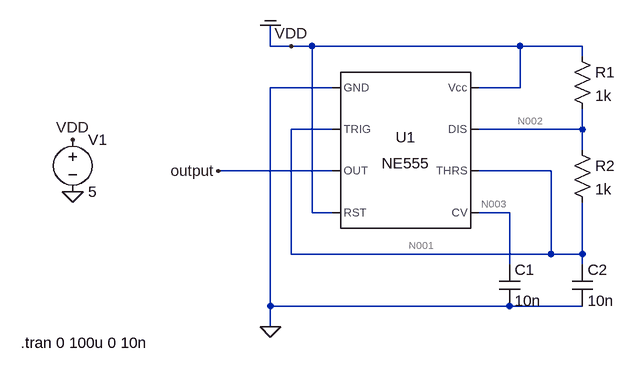
[diagram p0: schematic Design2_1k.asc]
Design2_1k.asc, the LTspice schematic file:
Version 4
SHEET 1 880 680
WIRE 16 16 16 -16
WIRE 48 16 16 16
WIRE 80 16 48 16
WIRE 400 16 80 16
WIRE 496 16 400 16
WIRE 496 32 496 16
WIRE 112 80 16 80
WIRE 400 80 400 16
WIRE 400 80 336 80
WIRE 112 144 48 144
WIRE 496 144 496 112
WIRE 496 144 336 144
WIRE 496 176 496 144
WIRE 112 208 -64 208
WIRE 448 208 336 208
WIRE 80 272 80 16
WIRE 112 272 80 272
WIRE 384 272 336 272
WIRE 48 336 48 144
WIRE 448 336 448 208
WIRE 448 336 48 336
WIRE 496 336 496 256
WIRE 496 336 448 336
WIRE 384 352 384 272
WIRE 496 352 496 336
WIRE 16 416 16 80
WIRE 384 416 16 416
WIRE 496 416 384 416
WIRE 16 448 16 416
FLAG 16 448 0
FLAG 16 -16 COM
FLAG 48 16 VDD
FLAG -64 208 output
FLAG -288 160 VDD
FLAG -288 240 0
SYMBOL Misc\\NE555 224 176 R0
SYMATTR InstName U1
SYMBOL cap 368 352 R0
SYMATTR InstName C1
SYMATTR Value 10n
SYMBOL cap 480 352 R0
SYMATTR InstName C2
SYMATTR Value 10n
SYMBOL res 480 16 R0
SYMATTR InstName R1
SYMATTR Value 1k
SYMBOL res 480 160 R0
SYMATTR InstName R2
SYMATTR Value 1k
SYMBOL voltage -288 144 R0
WINDOW 123 0 0 Left 0
WINDOW 39 0 0 Left 0
SYMATTR InstName V1
SYMATTR Value 5
TEXT -368 472 Left 2 !.tran 0 100u 0 10n

The netlist it stands for:
* Design2_1k.asc
XU1 0 N001 output VDD N003 N001 N002 VDD NE555  ; pins GND TRIG OUT RST CV THRS DIS Vcc
C1 N003 0 10n
C2 N001 0 10n
R1 VDD N002 1k
R2 N002 N001 1k
V1 VDD 0 5
.tran 0 100u 0 10n
.lib NE555.sub
.backanno
.end

* Results of the author's LTspice run, read from the files saved beside the schematic
* Operating Point, zero values left out:
*   V(n001) = 5 V
*   V(n003) = 3.333 V
*   V(vdd) = 5 V
*   V(n002) = 5 V
*   V(output) = 5 V
*   I(R2) = 10 nA
*   I(R1) = 16.67 nA
*   I(V1) = -1.611 mA
*   Ix(u1:1) = -1.611 mA
*   Ix(u1:2) = 5 nA
*   Ix(u1:4) = 22.67 µA
*   Ix(u1:6) = 5 nA
*   Ix(u1:7) = 6.672 nA
*   Ix(u1:8) = 1.588 mA
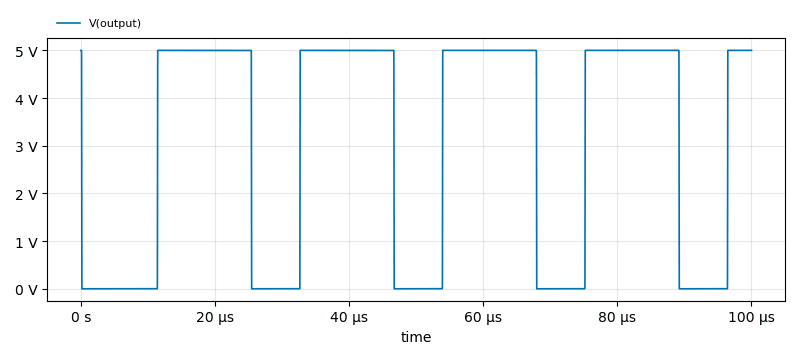
[diagram p1: Transient Analysis of Design2_1k.asc, plotted from the saved traces]
* Transient Analysis, 1 run:
*   V(output): min 30 µV, max 5 V, average 2.986 V, rms 3.863 V, last 5 V